# Altium schematic sheet Sheet1-BeforeClearParameters-20261026_114540_931.SchDoc (part 1 of 2)
size A4; SheetNumber: 1; SheetTotal: 1
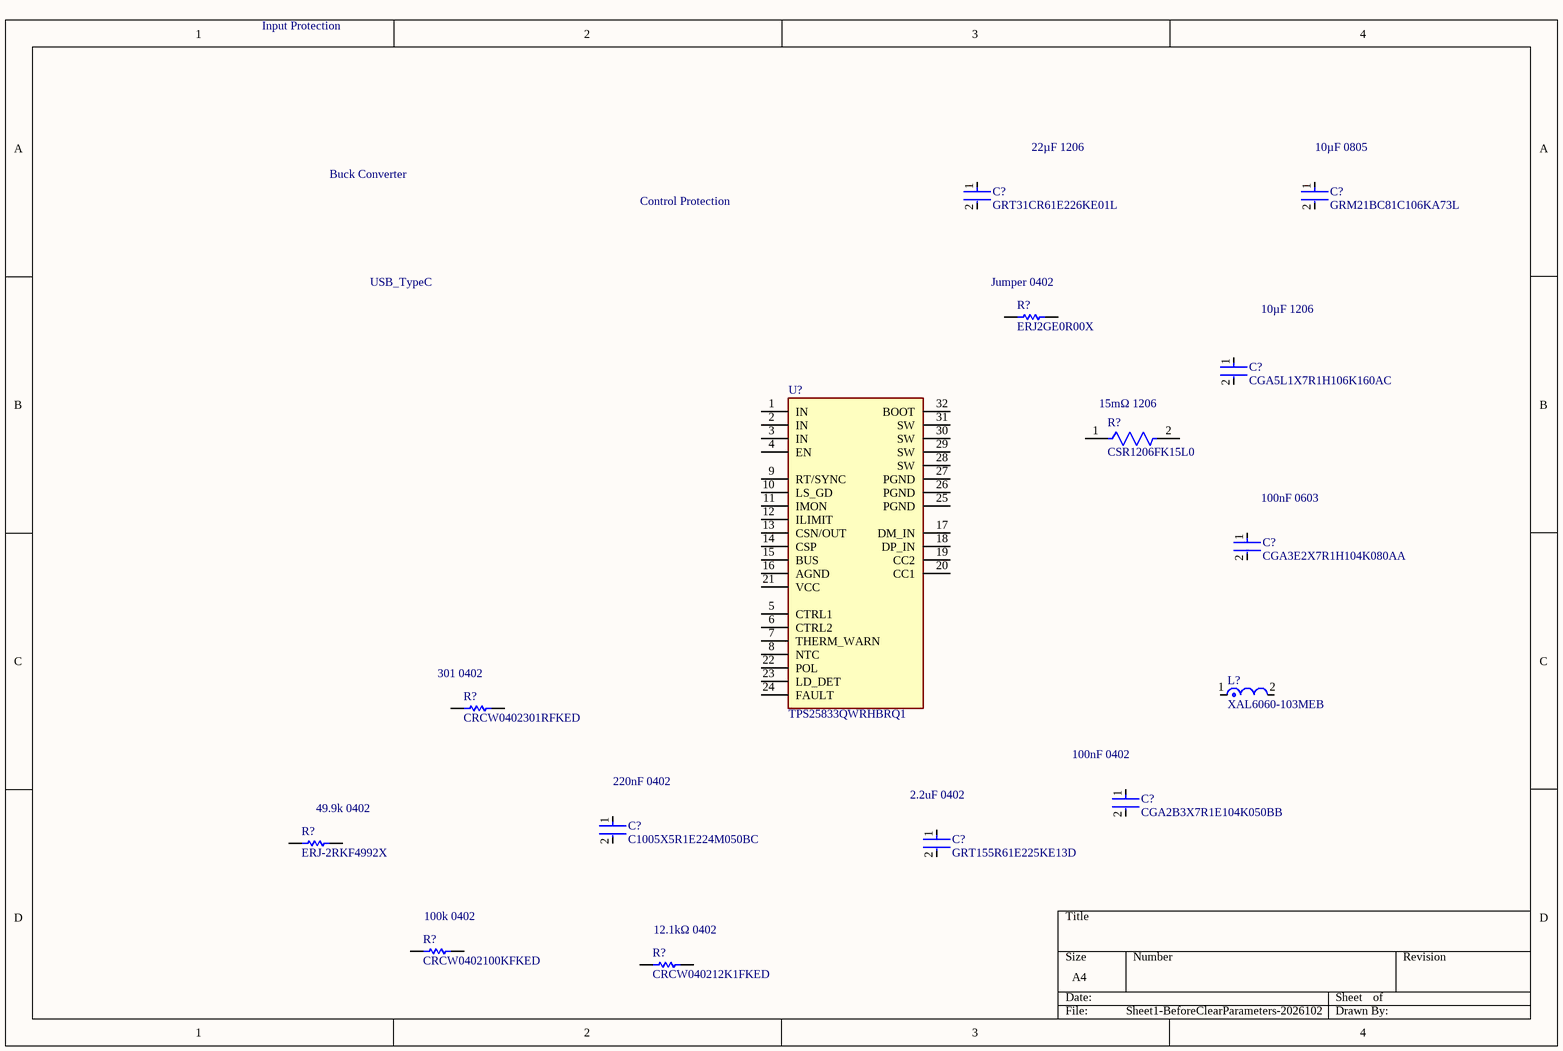
[diagram p0: Sheet1-BeforeClearParameters-20261026_114540_931.SchDoc]

## Parts
(Parts that share a designator on the sheet are numbered #1, #2 ... from top to bottom, then left to right.)
C?#1  GRT31CR61E226KE01L  [FP-CGA5L-0_3-0_1-MFG]
C?#2  GRM21BC81C106KA73L  [FP-GRM21B-0_15-MFG]
C?#3  CGA5L1X7R1H106K160AC  [FP-CGA5L-0_3-0_1-MFG]
C?#4  CGA3E2X7R1H104K080AA  [FP-CGA3E-0_3-0_1-IPC_A]
C?#5  CGA2B3X7R1E104K050BB  [FP-CGA2B-IPC_B]
C?#6  C1005X5R1E224M050BC  [FP-CGA2B-IPC_B]
C?#7  GRT155R61E225KE13D  [FP-CGA2B-IPC_B]
L?  XAL6060-103MEB  [FP-XAL6060-MFG]
R?#1  ERJ2GE0R00X  [RESC1005X40X25LL05T05]
R?#2  CSR1206FK15L0  [FP-CSR1206-IPC_B]
R?#3  CRCW0402301RFKED  [RESC1005X40X25LL05T05]
R?#4  ERJ-2RKF4992X  [RESC1005X40X25LL05T05]
R?#5  CRCW0402100KFKED  [RESC1005X40X25LL05T05]
R?#6  CRCW040212K1FKED  [RESC1005X40X25LL05T05]
U?  TPS25833QWRHBRQ1  [FP-RHB0032D-IPC_A]

## Nets

Not connected (* = marked no-connect by the designer): C?#1 1 2; C?#2 1 2; C?#3 1 2; C?#4 1 2; C?#5 1 2; C?#6 1 2; C?#7 1 2; L? 1 2; R?#1 1 2; R?#2 1 2; R?#3 1 2; R?#4 1 2; R?#5 1 2; R?#6 1 2; U? 1(IN) 2(IN) 3(IN) 4(EN) 5(CTRL1) 6(CTRL2) 7(THERM_WARN) 8(NTC) 9(RT/SYNC) 10(LS_GD) 11(IMON) 12(ILIMIT) 13(CSN/OUT) 14(CSP) 15(BUS) 16(AGND) 17(DM_IN) 18(DP_IN) 19(CC2) 20(CC1) 21(VCC) 22(POL) 23(LD_DET) 24(FAULT) 25(PGND) 26(PGND) 27(PGND) 28(SW) 29(SW) 30(SW) 31(SW) 32(BOOT)

## Notes on the sheet
- Input Protection
- Buck Converter
- 22µF 1206
- (near C?#2) 10µF 0805
- Control Protection
- USB_TypeC
- (near R?#1) Jumper 0402
- 10µF 1206
- (near R?#2) 15mΩ 1206
- (near C?#4) 100nF 0603
- (near R?#3) 301 0402
- (near C?#6) 220nF 0402
- (near C?#7) 2.2uF 0402
- (near C?#5) 100nF 0402
- (near R?#4) 49.9k 0402
- (near R?#5) 100k 0402
- (near R?#6) 12.1kΩ 0402